# Altium schematic sheet f.main controller.SchDoc
size D; SheetNumber: 1; SheetTotal: 1
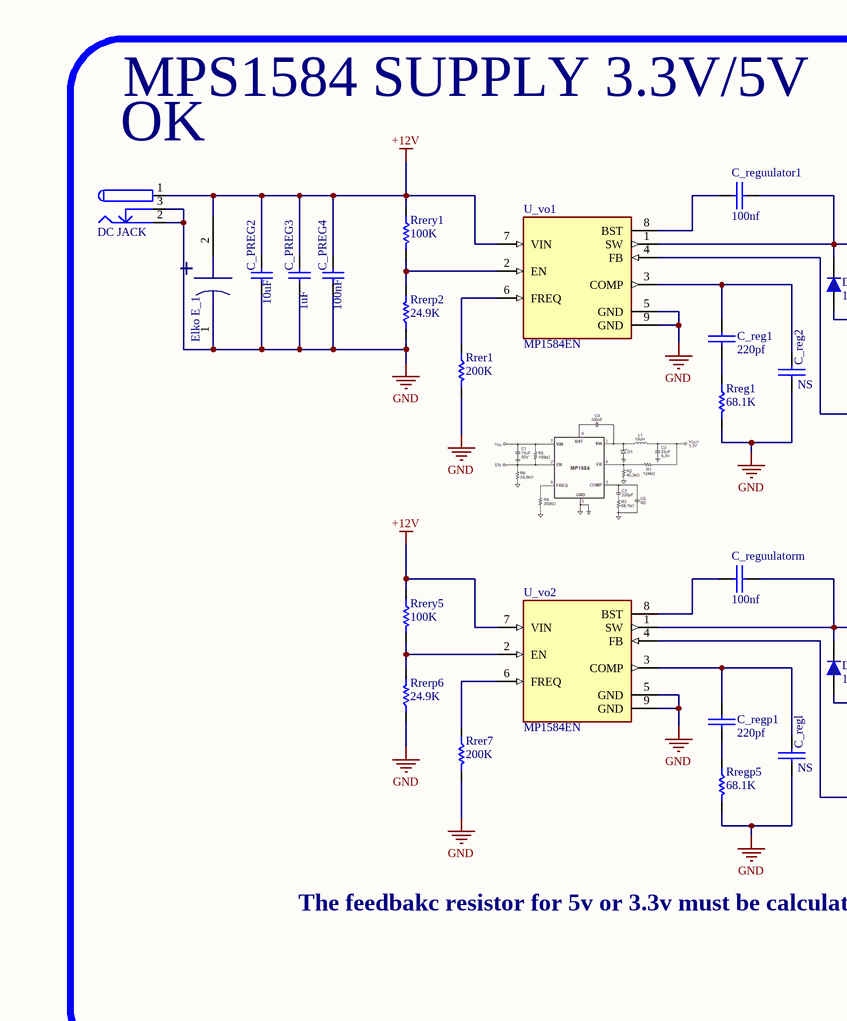
[diagram p0: f.main controller.SchDoc, top left]
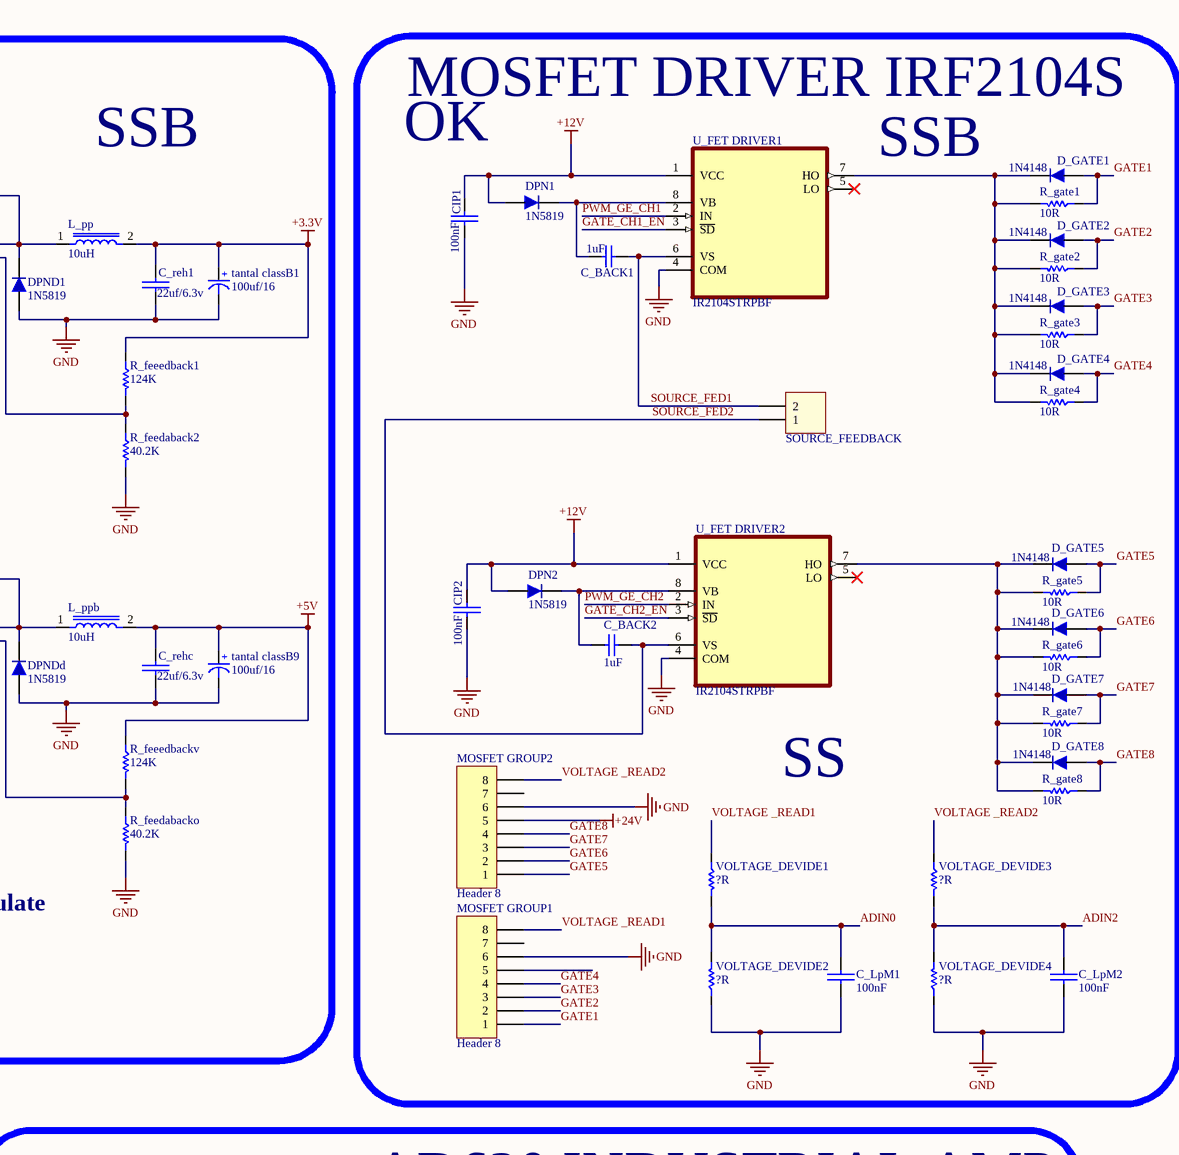
[diagram p1: f.main controller.SchDoc, top middle]
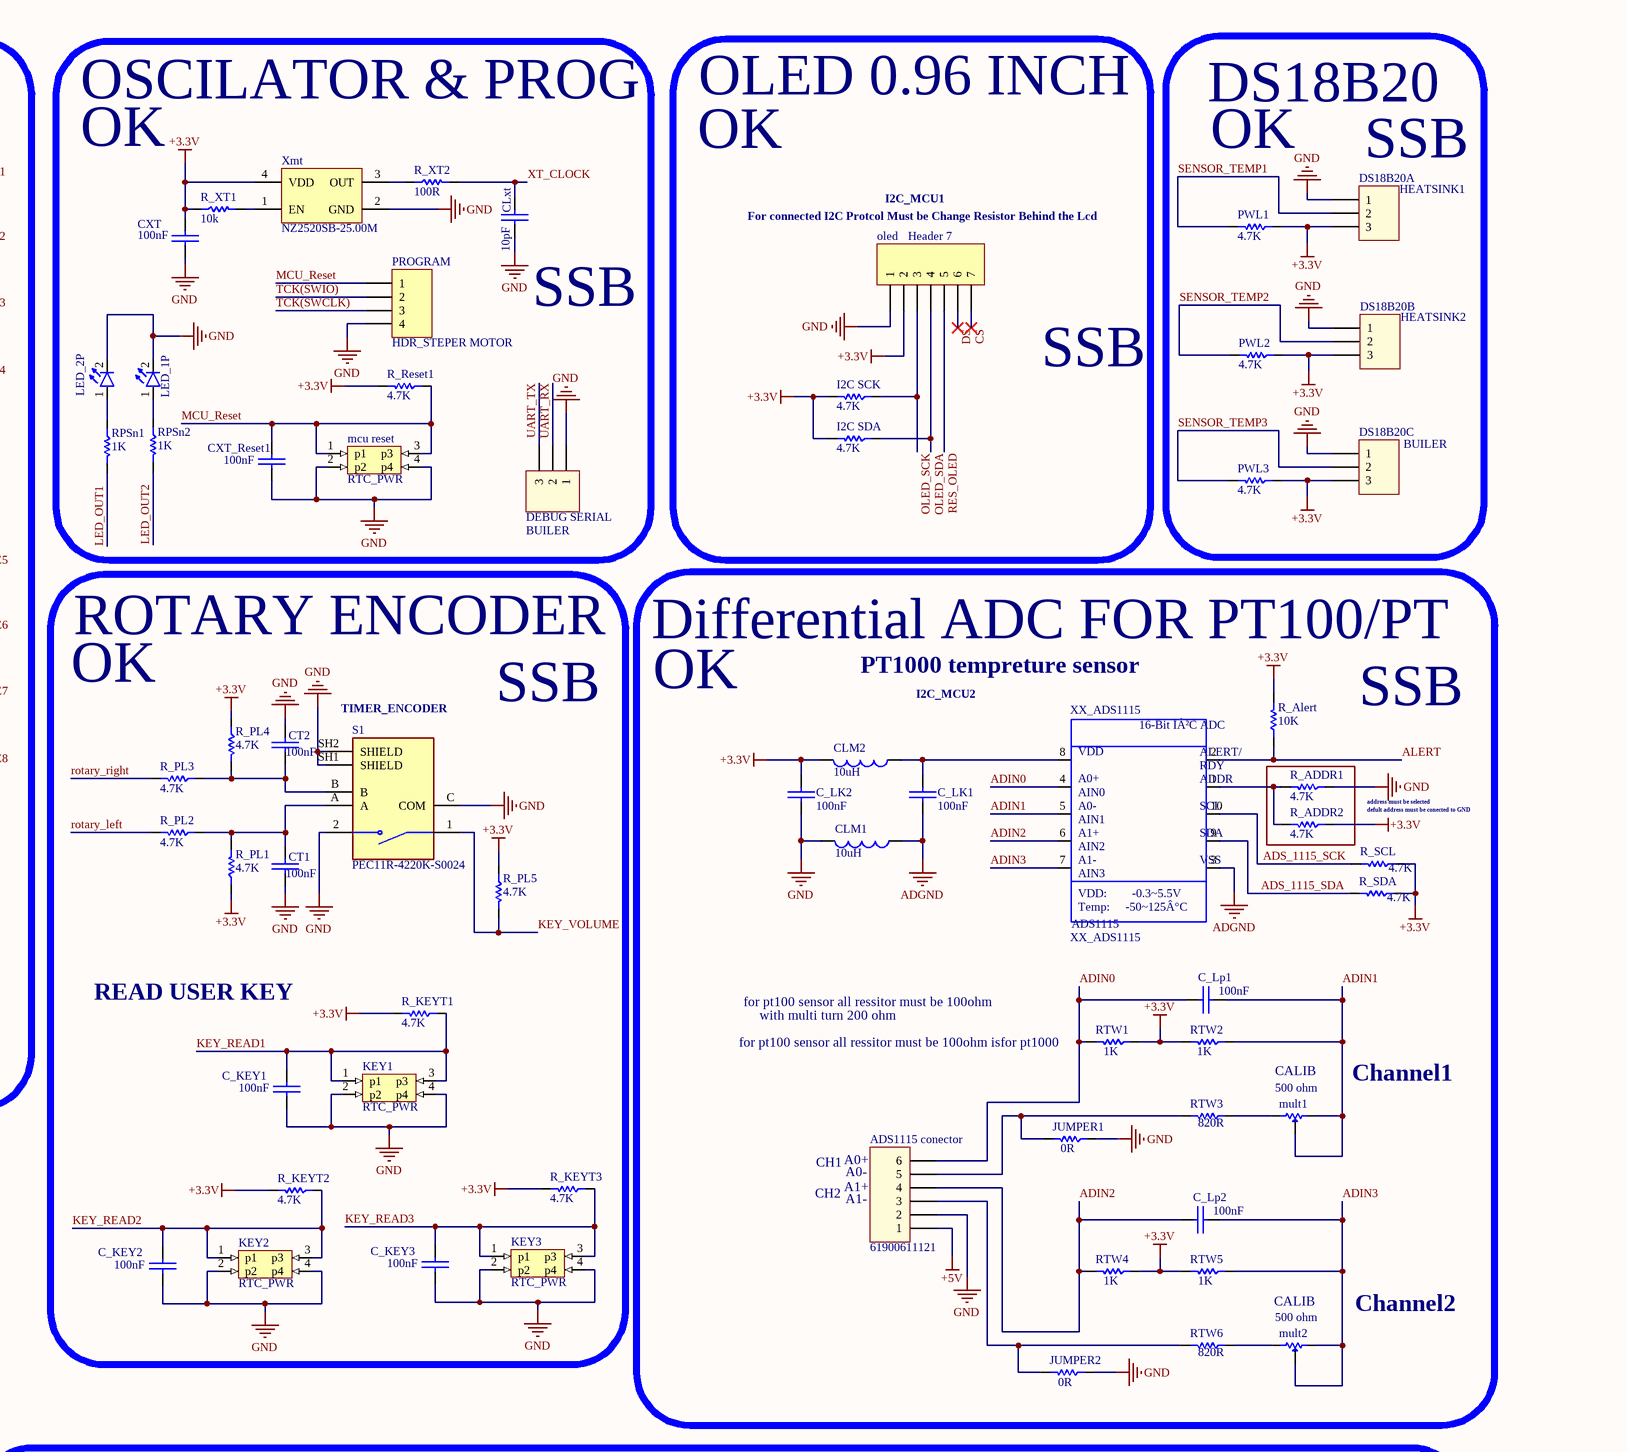
[diagram p2: f.main controller.SchDoc, top right]
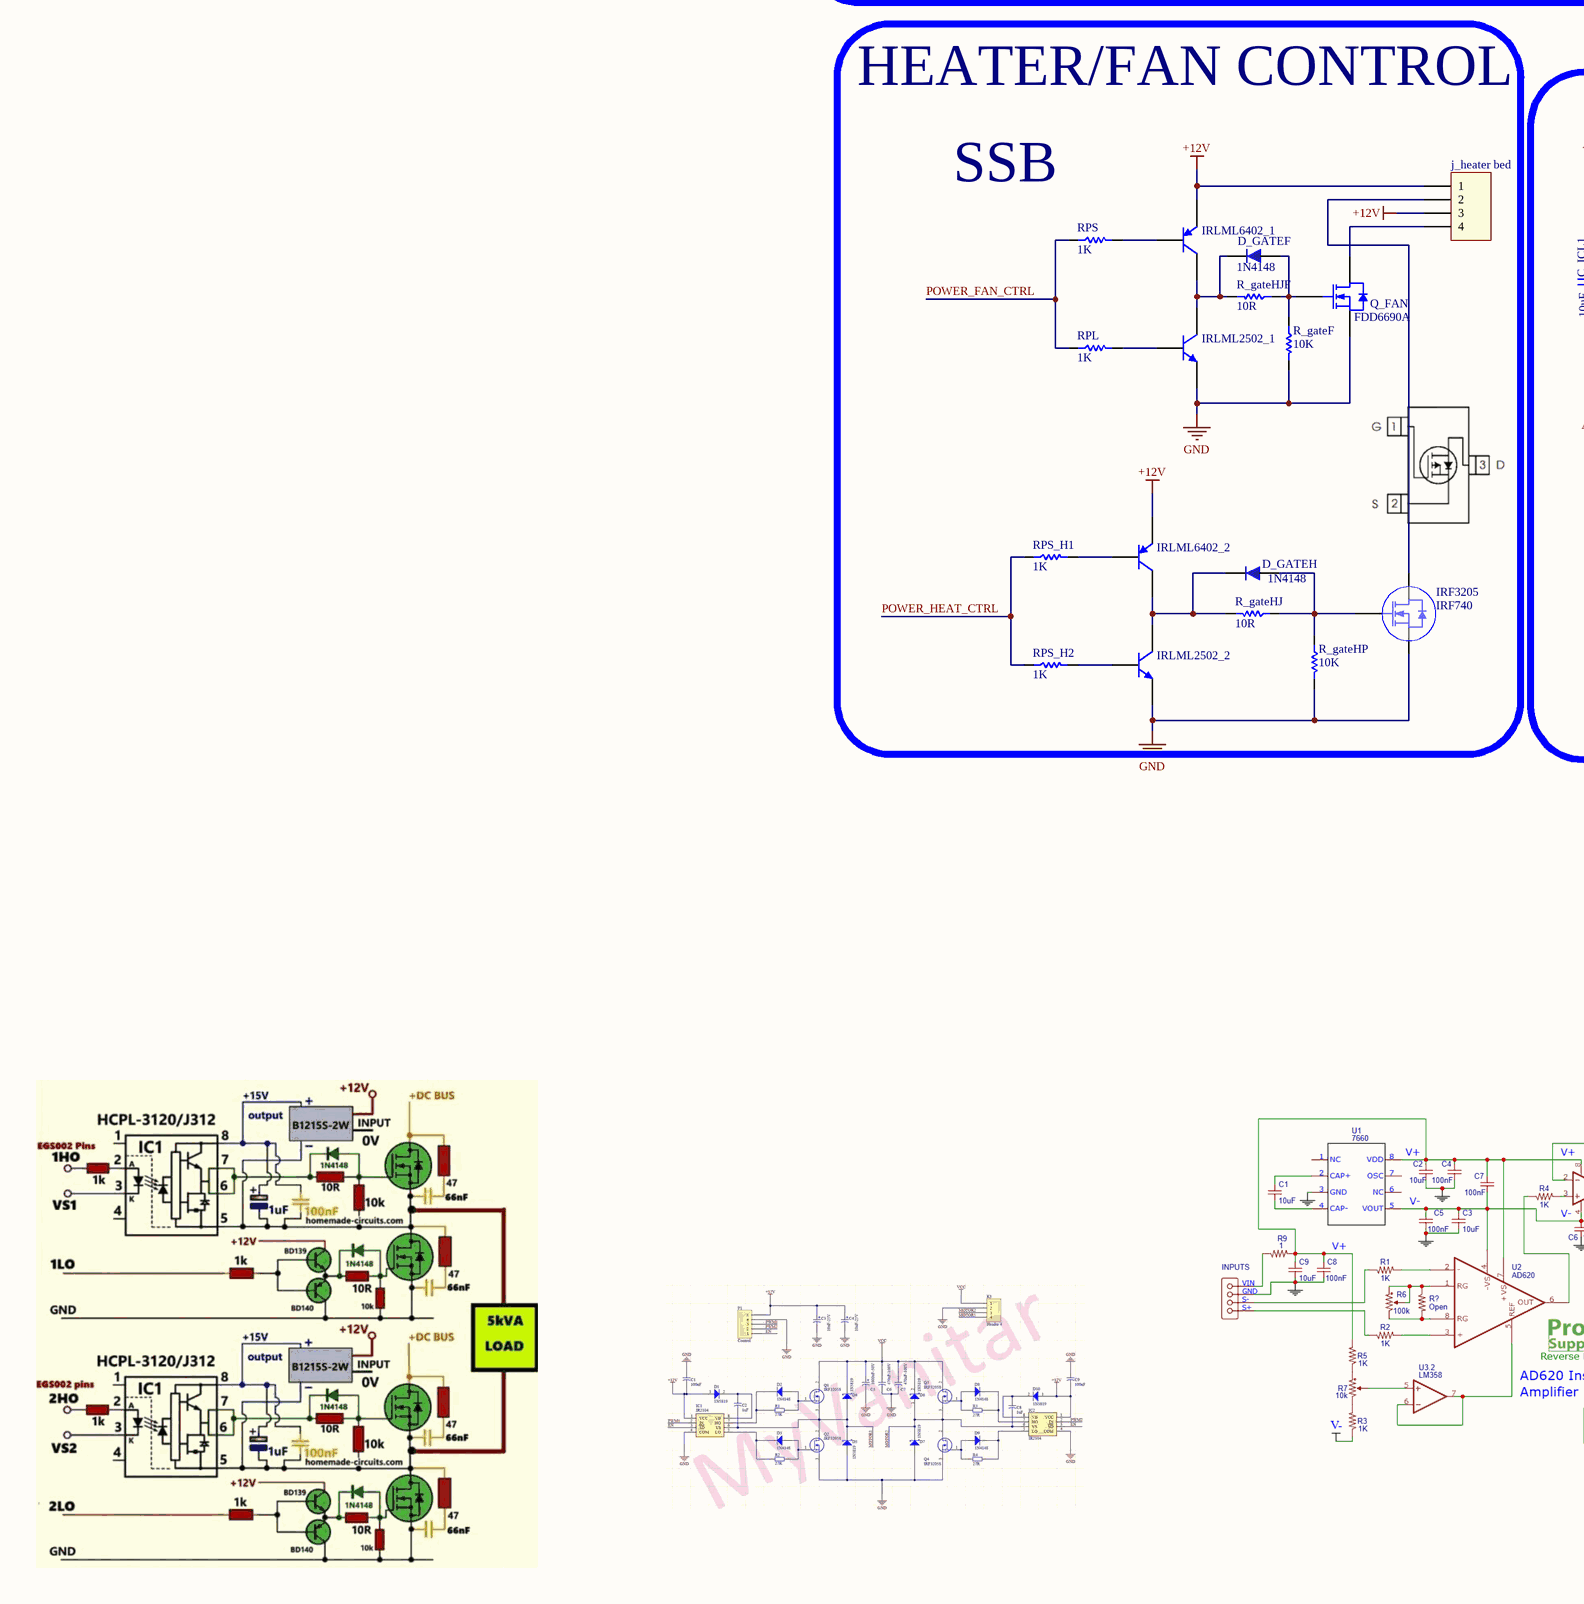
[diagram p3: f.main controller.SchDoc, bottom left]
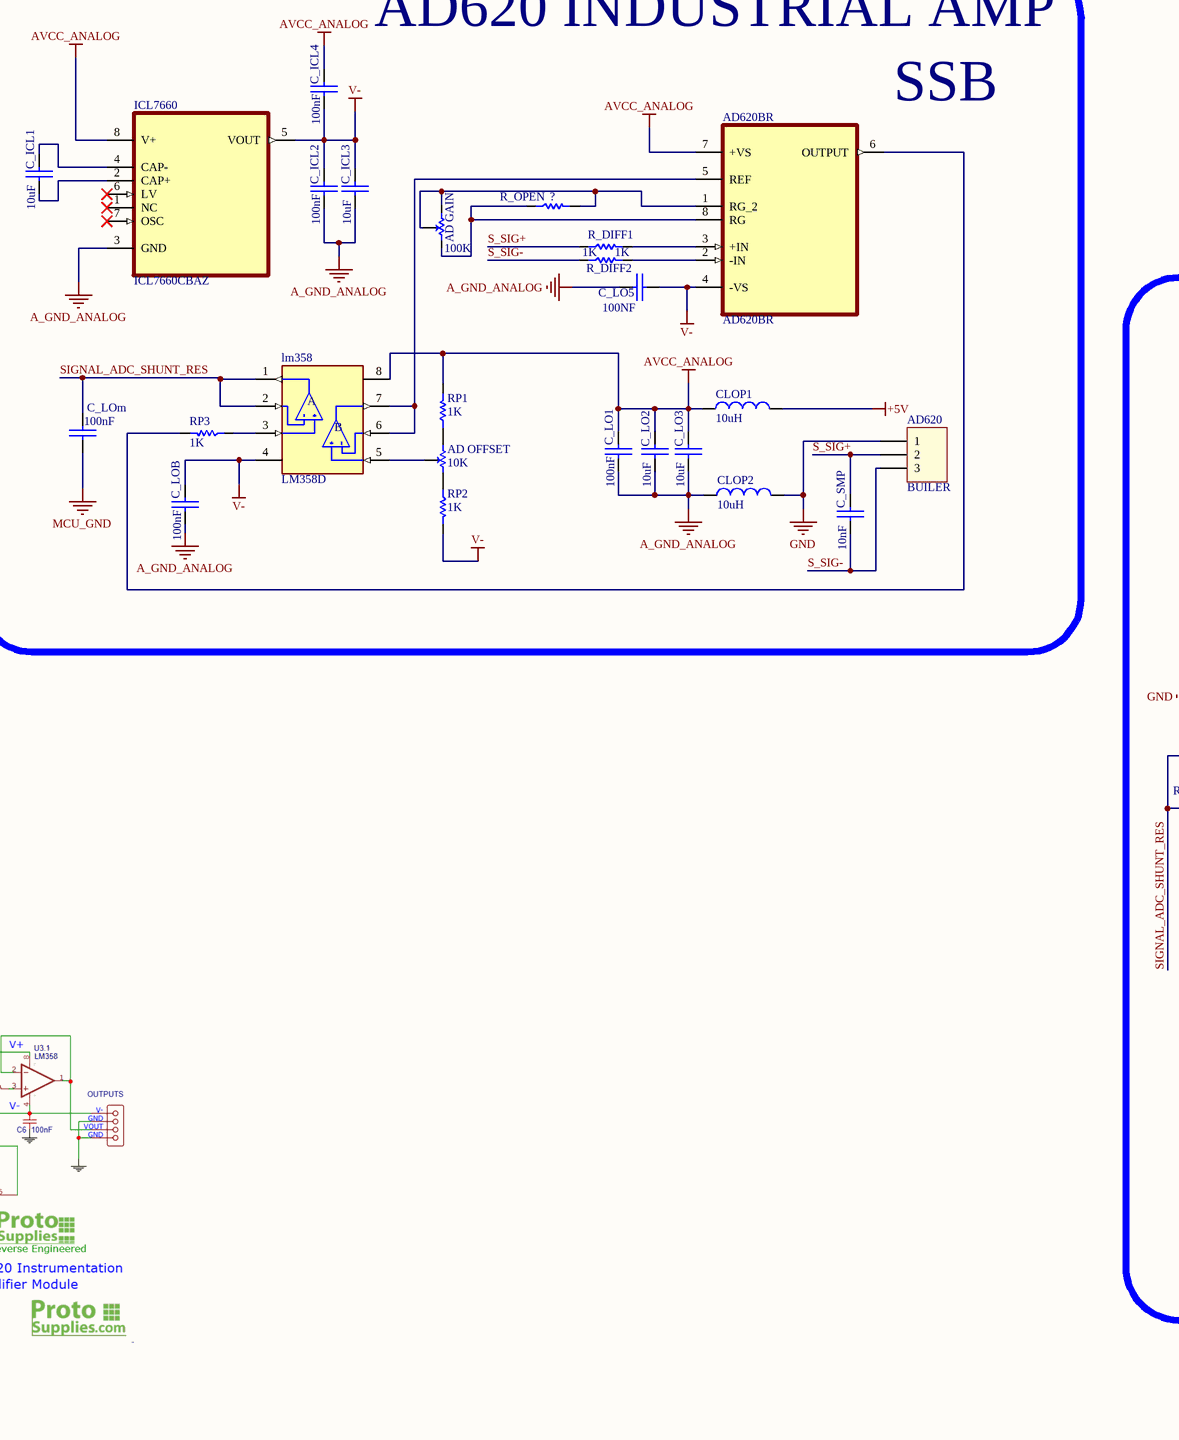
[diagram p4: f.main controller.SchDoc, bottom middle]
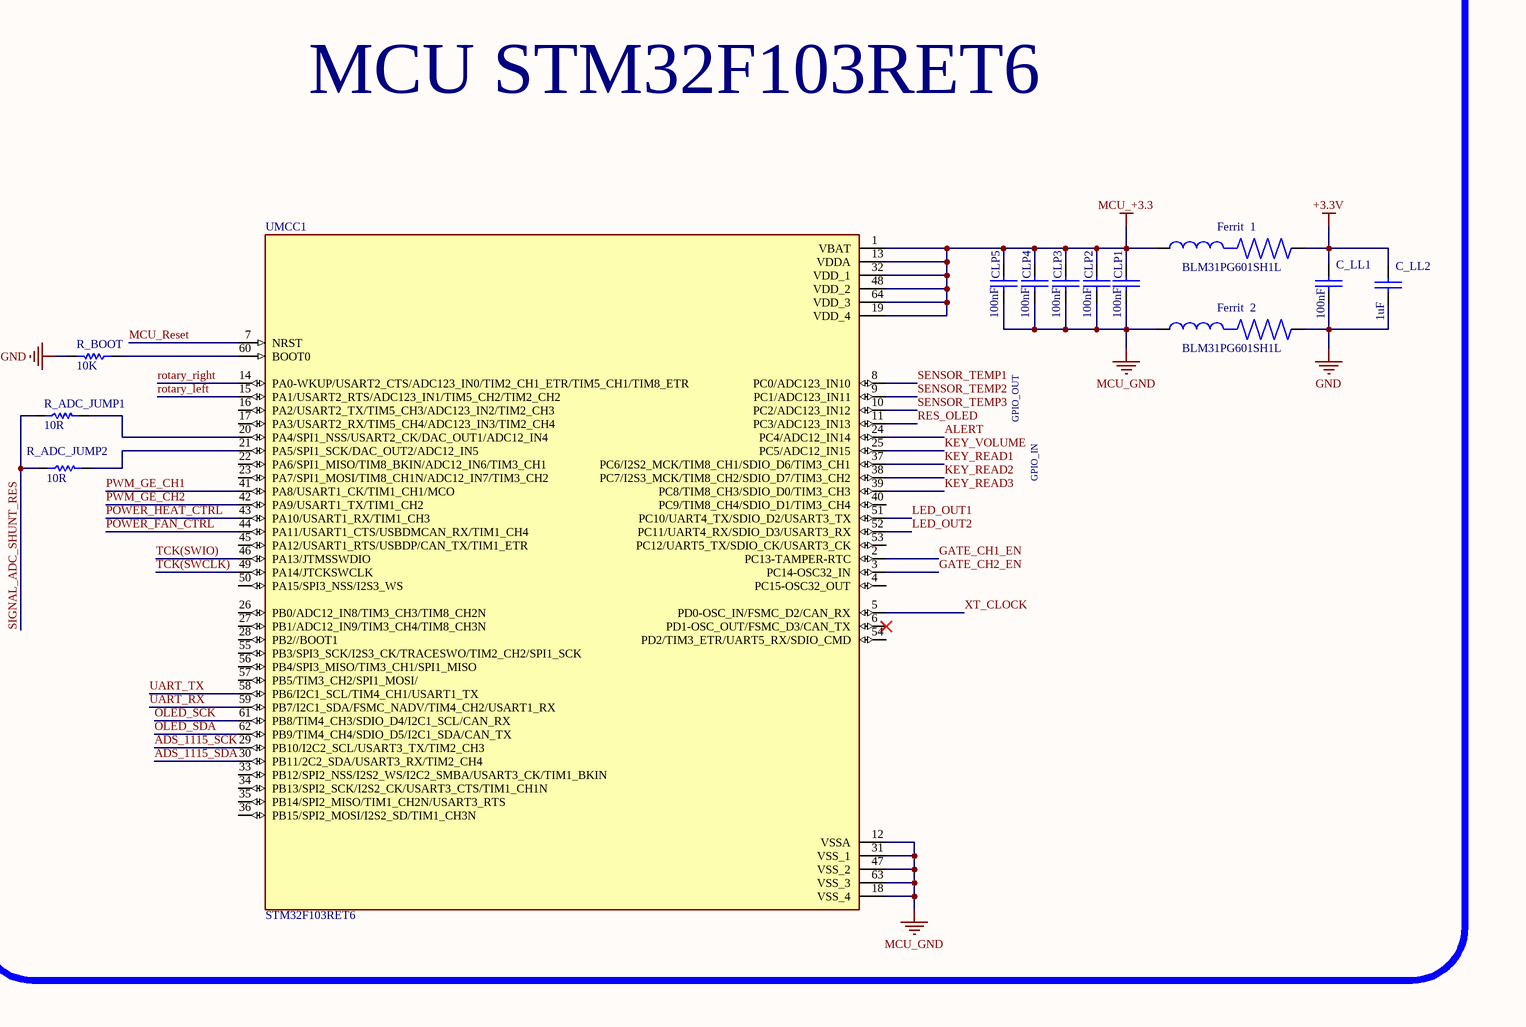
[diagram p5: f.main controller.SchDoc, bottom right]

## Parts
AD620  BUILER  [61900311121]
AD620BR  AD620BR  [SOIC127P600X175-8N]
AD_GAIN  100K  [Multi Turn]
AD_OFFSET  10K  [Multi Turn]
ADS1115_conector  61900611121  [61900611121]
C_BACK1  1uF  [CAPC4817X12N]
C_BACK2  1uF  [CAPC4817X12N]
C_ICL1  value 10uF  [SMD_CAP_0603]  (hidden comment: 100nf)
C_ICL2  100nf  [SMD_CAP_0603]
C_ICL3  value 10uF  [SMD_CAP_0603]  (hidden comment: 100nf)
C_ICL4  100nf  [SMD_CAP_0603]
C_KEY1  100nf  [SMD_CAP_0603]
C_KEY2  100nf  [SMD_CAP_0603]
C_KEY3  100nf  [SMD_CAP_0603]
C_LK1  100nf  [SMD_CAP_0603]
C_LK2  100nf  [SMD_CAP_0603]
C_LL1  100nf  [SMD_CAP_0603]
C_LL2  value 1uF  [SMD_CAP_0603]  (hidden comment: 100nf)
C_LO1  100nf  [SMD_CAP_0603]
C_LO2  value 10uF  [SMD_CAP_0603]  (hidden comment: 100nf)
C_LO3  value 10uF  [SMD_CAP_0603]  (hidden comment: 100nf)
C_LO5  100nf  [SMD_CAP_0603]
C_LOB  100nf  [SMD_CAP_0603]
C_LOm  100nf  [SMD_CAP_0603]
C_Lp1  100nf  [SMD_CAP_0603]
C_Lp2  100nf  [SMD_CAP_0603]
C_LpM1  100nf  [SMD_CAP_0603]
C_LpM2  100nf  [SMD_CAP_0603]
C_PREG2  10uF  [CAPC4817X12N]
C_PREG3  1uF  [CAPC4817X12N]
C_PREG4  100nF  [CAPC4817X12N]
C_reg1  value 220pf  [SMD_CAP_0603]  (hidden comment: 100nf)
C_reg2  NS  [SMD_CAP_0603]
C_regl  NS  [SMD_CAP_0603]
C_regp1  value 220pf  [SMD_CAP_0603]  (hidden comment: 100nf)
C_reguulator1  value 100nf  [SMD_CAP_0603]  (hidden comment: 22uf/6.3v)
C_reguulatorm  value 100nf  [SMD_CAP_0603]  (hidden comment: 22uf/6.3v)
C_reh1  22uf/6.3v  [SMD_CAP_0603]
C_rehc  22uf/6.3v  [SMD_CAP_0603]
C_SMP  10nf  [SMD_CAP_0603]
CIP1  100nf  [SMD_CAP_0603]
CIP2  100nf  [SMD_CAP_0603]
CLM1  10uH  [IND0805]
CLM2  10uH  [IND0805]
CLOP1  10uH  [IND0805]
CLOP2  10uH  [IND0805]
CLP1  100nf  [SMD_CAP_0603]
CLP2  100nf  [SMD_CAP_0603]
CLP3  100nf  [SMD_CAP_0603]
CLP4  100nf  [SMD_CAP_0603]
CLP5  100nf  [SMD_CAP_0603]
CLxt  value 10pF  [SMD_CAP_0603]  (hidden comment: 100nf)
CT1  100nf  [SMD_CAP_0603]
CT2  100nf  [SMD_CAP_0603]
CXT  100nf  [SMD_CAP_0603]
CXT_Reset1  100nf  [SMD_CAP_0603]
D_GATE1  1N4148  [Diode 1n4148 SMD]
D_GATE2  1N4148  [Diode 1n4148 SMD]
D_GATE3  1N4148  [Diode 1n4148 SMD]
D_GATE4  1N4148  [Diode 1n4148 SMD]
D_GATE5  1N4148  [Diode 1n4148 SMD]
D_GATE6  1N4148  [Diode 1n4148 SMD]
D_GATE7  1N4148  [Diode 1n4148 SMD]
D_GATE8  1N4148  [Diode 1n4148 SMD]
D_GATEF  1N4148  [Diode 1n4148 SMD]
D_GATEH  1N4148  [Diode 1n4148 SMD]
DC_JACK  DC Power Jack  [DC Power Jack 1]  (value not drawn)
DEBUG_SERIAL  BUILER  [61900311121]
DPN1  1N5819  [430X270D]
DPN2  1N5819  [430X270D]
DPND1  1N5819  [430X270D]
DPNDd  1N5819  [430X270D]
DS18B20A  HEATSINK1  [61900311121]
DS18B20B  HEATSINK2  [61900311121]
DS18B20C  BUILER  [61900311121]
Elko_E_1  Elko E package  [Elko E]  (value not drawn)
Ferrit_1  BLM31PG601SH1L  [BEADC3216X130N]
Ferrit_2  BLM31PG601SH1L  [BEADC3216X130N]
I2C_SCK  4.7K  [RES 0603 (1608X06L)]
I2C_SDA  4.7K  [RES 0603 (1608X06L)]
ICL7660  ICL7660CBAZ  [SOIC127P600X175-8N]
IRF3205  IRF740  [TO-220 AB]
IRLML2502_1  BC337  [SOT23_M]  (value not drawn)
IRLML2502_2  BC337  [SOT23_M]  (value not drawn)
IRLML6402_1  BC856  [SOT23_M]  (value not drawn)
IRLML6402_2  BC856  [SOT23_M]  (value not drawn)
j_heater_bed  (no value)  [645004114822]
JUMPER1  0R  [RES 0603 (1608X06L)]
JUMPER2  0R  [RES 0603 (1608X06L)]
KEY1  RTC_PWR  [push_bt]
KEY2  RTC_PWR  [push_bt]
KEY3  RTC_PWR  [push_bt]
L_pp  10uH  [IND_SRP6540-4R7M]
L_ppb  10uH  [IND_SRP6540-4R7M]
LED_1P  (no value)  [LED SMD 1206]
LED_2P  (no value)  [LED SMD 1206]
lm358  LM358D  [SOIC127P599X175-8N]
mcu_reset  RTC_PWR  [push_bt]
MOSFET_GROUP1  Header 8  [HDR1X8]
MOSFET_GROUP2  Header 8  [HDR1X8]
mult1  500 ohm  [Multi Turn]
mult2  500 ohm  [Multi Turn]
oled  Header 7  [HDR1X7]
PROGRAM  HDR_STEPER MOTOR  [CON WF_4]
PWL1  4.7K  [RES 0603 (1608X06L)]
PWL2  4.7K  [RES 0603 (1608X06L)]
PWL3  4.7K  [RES 0603 (1608X06L)]
Q_FAN  FDD6690A  [TO252-3L]
R_ADC_JUMP1  10R  [RES 0603 (1608X06L)]
R_ADC_JUMP2  10R  [RES 0603 (1608X06L)]
R_ADDR1  4.7K  [RES 0603 (1608X06L)]
R_ADDR2  4.7K  [RES 0603 (1608X06L)]
R_Alert  10K  [RES 0603 (1608X06L)]
R_BOOT  10K  [RES 0603 (1608X06L)]
R_DIFF1  1K  [RES 0603 (1608X06L)]
R_DIFF2  1K  [RES 0603 (1608X06L)]
R_feedaback2  40.2K  [RES 0603 (1608X06L)]
R_feedabacko  40.2K  [RES 0603 (1608X06L)]
R_feeedback1  124K  [RES 0603 (1608X06L)]
R_feeedbackv  124K  [RES 0603 (1608X06L)]
R_gate1  10R  [RES 0603 (1608X06L)]
R_gate2  10R  [RES 0603 (1608X06L)]
R_gate3  10R  [RES 0603 (1608X06L)]
R_gate4  10R  [RES 0603 (1608X06L)]
R_gate5  10R  [RES 0603 (1608X06L)]
R_gate6  10R  [RES 0603 (1608X06L)]
R_gate7  10R  [RES 0603 (1608X06L)]
R_gate8  10R  [RES 0603 (1608X06L)]
R_gateF  10K  [RES 0603 (1608X06L)]
R_gateHJ  10R  [RES 0603 (1608X06L)]
R_gateHJF  10R  [RES 0603 (1608X06L)]
R_gateHP  10K  [RES 0603 (1608X06L)]
R_KEYT1  4.7K  [RES 0603 (1608X06L)]
R_KEYT2  4.7K  [RES 0603 (1608X06L)]
R_KEYT3  4.7K  [RES 0603 (1608X06L)]
R_OPEN  ?  [RES 0603 (1608X06L)]
R_PL1  4.7K  [RES 0603 (1608X06L)]
R_PL2  4.7K  [RES 0603 (1608X06L)]
R_PL3  4.7K  [RES 0603 (1608X06L)]
R_PL4  4.7K  [RES 0603 (1608X06L)]
R_PL5  4.7K  [RES 0603 (1608X06L)]
R_Reset1  4.7K  [RES 0603 (1608X06L)]
R_SCL  4.7K  [RES 0603 (1608X06L)]
R_SDA  4.7K  [RES 0603 (1608X06L)]
R_XT1  10k  [RES 0603 (1608X06L)]
R_XT2  100R  [RES 0603 (1608X06L)]
RP1  1K  [RES 0603 (1608X06L)]
RP2  1K  [RES 0603 (1608X06L)]
RP3  1K  [RES 0603 (1608X06L)]
RPL  1K  [RES 0603 (1608X06L)]
RPS  1K  [RES 0603 (1608X06L)]
RPS_H1  1K  [RES 0603 (1608X06L)]
RPS_H2  1K  [RES 0603 (1608X06L)]
RPSn1  1K  [RES 0603 (1608X06L)]
RPSn2  1K  [RES 0603 (1608X06L)]
Rreg1  68.1K  [RES 0603 (1608X06L)]
Rregp5  68.1K  [RES 0603 (1608X06L)]
Rrer1  200K  [RES 0603 (1608X06L)]
Rrer7  200K  [RES 0603 (1608X06L)]
Rrerp2  24.9K  [RES 0603 (1608X06L)]
Rrerp6  24.9K  [RES 0603 (1608X06L)]
Rrery1  100K  [RES 0603 (1608X06L)]
Rrery5  100K  [RES 0603 (1608X06L)]
RTW1  1K  [RES 0603 (1608X06L)]
RTW2  1K  [RES 0603 (1608X06L)]
RTW3  820R  [RES 0603 (1608X06L)]
RTW4  1K  [RES 0603 (1608X06L)]
RTW5  1K  [RES 0603 (1608X06L)]
RTW6  820R  [RES 0603 (1608X06L)]
S1  PEC11R-4220K-S0024  [XDCR_PEC11R-4220K-S0024]
SOURCE_FEEDBACK  61900211121  [61900211121]  (value not drawn)
tantal_classB1  100uf/16  [TANTAL-CAP-Size B]
tantal_classB9  100uf/16  [TANTAL-CAP-Size B]
U_FET_DRIVER1  IR2104STRPBF  [SOIC127P600X175-8N]
U_FET_DRIVER2  IR2104STRPBF  [SOIC127P600X175-8N]
U_vo1  MP1584EN  [SOIC127P600X170-9N]
U_vo2  MP1584EN  [SOIC127P600X170-9N]
UMCC1  STM32F103RET6  [QFP50P1200X1200X160-64N]
VOLTAGE_DEVIDE1  ?R  [RES 0603 (1608X06L)]
VOLTAGE_DEVIDE2  ?R  [RES 0603 (1608X06L)]
VOLTAGE_DEVIDE3  ?R  [RES 0603 (1608X06L)]
VOLTAGE_DEVIDE4  ?R  [RES 0603 (1608X06L)]
Xmt  NZ2520SB-25.00M  [VCO]
XX_ADS1115  XX_ADS1115  [MSOP10]

## Blocks framed on the sheet
MCU STM32F103RET6: C_LL1 C_LL2 CLP1-CLP5 Ferrit_1 Ferrit_2 R_ADC_JUMP1 R_ADC_JUMP2 R_BOOT UMCC1

## Nets
+3.3V: C_LK2.2(-) C_LL1.1(+) C_LL2.1(+) C_reh1.1(+) CLM2.2 CXT.1(+) DS18B20A.3 DS18B20B.3 DS18B20C.3 Ferrit_1.2 I2C_SCK.2 I2C_SDA.2 L_pp.2 oled.2 PWL1.1 PWL2.1 PWL3.1 R_ADDR2.1 R_Alert.2 R_feeedback1.1 R_KEYT1.2 R_KEYT2.2 R_KEYT3.2 R_PL1.1 R_PL4.1 R_PL5.1 R_Reset1.2 R_SCL.1 R_SDA.1 R_XT1.1 RTW1.1 RTW2.2 RTW4.1 RTW5.2 tantal_classB1.2(+) Xmt.4(VDD)
+5V: ADS1115_conector.1 C_rehc.1(+) CLOP1.2 L_ppb.2 R_feeedbackv.1 tantal_classB9.2(+)
+12V: C_PREG2.2 C_PREG3.2 C_PREG4.2 CIP1.1(+) CIP2.1(+) DC_JACK.1 DPN1.1 DPN2.1 Elko_E_1.2 IRLML6402_1.2(E) IRLML6402_2.2(E) j_heater_bed.1 j_heater_bed.3 Rrery1.1 Rrery5.1 U_FET_DRIVER1.1(VCC) U_FET_DRIVER2.1(VCC) U_vo1.7(VIN) U_vo2.7(VIN)
+24V: MOSFET_GROUP2.5
A_GND_ANALOG: C_ICL2.2(-) C_ICL3.2(-) C_LO1.2(-) C_LO2.2(-) C_LO3.2(-) C_LO5.2(-) C_LOB.2(-) CLOP2.1 ICL7660.3(GND)
ADGND: C_LK1.1(+) CLM1.1 XX_ADS1115.3(VSS)
AVCC_ANALOG: AD620BR.7(+VS) C_ICL4.1(+) C_LO1.1(+) C_LO2.1(+) C_LO3.1(+) CLOP1.1 ICL7660.8(V+) lm358.8(V+) RP1.2
GND: AD620.1 ADS1115_conector.2 C_KEY1.2(-) C_KEY2.2(-) C_KEY3.2(-) C_LK2.1(+) C_LL1.2(-) C_LL2.2(-) C_LpM1.1(+) C_LpM2.1(+) C_PREG2.1 C_PREG3.1 C_PREG4.1 C_reg2.2(-) C_regl.2(-) C_reh1.2(-) C_rehc.2(-) CIP1.2(-) CIP2.2(-) CLM1.2 CLOP2.2 CLxt.2(-) CT1.2(-) CT2.1(+) CXT.2(-) CXT_Reset1.2(-) DC_JACK.2 DC_JACK.3 DEBUG_SERIAL.1 DPND1.1 DPNDd.1 DS18B20A.1 DS18B20B.1 DS18B20C.1 Elko_E_1.1 Ferrit_2.2 IRF3205.3(S) IRLML2502_1.2(E) IRLML2502_2.2(E) JUMPER1.1 JUMPER2.1 KEY1.2(p2) KEY1.4(p4) KEY2.2(p2) KEY2.4(p4) KEY3.2(p2) KEY3.4(p4) LED_1P.2(K) LED_2P.2(K) mcu_reset.2(p2) mcu_reset.4(p4) MOSFET_GROUP1.6 MOSFET_GROUP2.6 oled.1 PROGRAM.4 Q_FAN.3(S) R_ADDR1.1 R_BOOT.2 R_feedaback2.2 R_feedabacko.2 R_gateF.2 R_gateHP.2 Rreg1.2 Rregp5.2 Rrer1.2 Rrer7.2 Rrerp2.1 Rrerp6.1 S1.2 S1.C(COM) S1.SH1(SHIELD) S1.SH2(SHIELD) tantal_classB1.1(-) tantal_classB9.1(-) U_FET_DRIVER1.4(COM) U_FET_DRIVER2.4(COM) U_vo1.5(GND) U_vo1.9(GND) U_vo2.5(GND) U_vo2.9(GND) VOLTAGE_DEVIDE2.1 VOLTAGE_DEVIDE4.1 Xmt.2(GND)
MCU_+3.3: CLP1.1(+) CLP2.1(+) CLP3.1(+) CLP4.1(+) CLP5.1(+) Ferrit_1.1 UMCC1.1(VBAT) UMCC1.13(VDDA) UMCC1.19(VDD_4) UMCC1.32(VDD_1) UMCC1.48(VDD_2) UMCC1.64(VDD_3)
MCU_GND: C_LOm.2(-) CLP1.2(-) CLP2.2(-) CLP3.2(-) CLP4.2(-) CLP5.2(-) Ferrit_2.1 UMCC1.12(VSSA) UMCC1.18(VSS_4) UMCC1.31(VSS_1) UMCC1.47(VSS_2) UMCC1.63(VSS_3)
V-: AD620BR.4(-VS) C_ICL2.1(+) C_ICL3.1(+) C_ICL4.2(-) C_LO5.1(+) C_LOB.1(+) ICL7660.5(VOUT) lm358.4(V-) RP2.2
ADIN0: ADS1115_conector.6 C_Lp1.1(+) C_LpM1.2(-) RTW1.2 VOLTAGE_DEVIDE1.2 VOLTAGE_DEVIDE2.2 XX_ADS1115.4(AIN0)
ADIN1: C_Lp1.2(-) mult1.2(Setpoint) mult1.3(CW) RTW2.1 XX_ADS1115.5(AIN1)
ADIN2: ADS1115_conector.4 C_Lp2.1(+) C_LpM2.2(-) RTW4.2 VOLTAGE_DEVIDE3.2 VOLTAGE_DEVIDE4.2 XX_ADS1115.6(AIN2)
ADIN3: C_Lp2.2(-) mult2.2(Setpoint) mult2.3(CW) RTW5.1 XX_ADS1115.7(AIN3)
ADS_1115_SCK: R_SCL.2 UMCC1.29(PB10/I2C2_SCL/USART3_TX/TIM2_CH3) XX_ADS1115.10(SCL)
ADS_1115_SDA: R_SDA.2 UMCC1.30(PB11/2C2_SDA/USART3_RX/TIM2_CH4) XX_ADS1115.9(SDA)
ALERT: R_Alert.1 UMCC1.24(PC4/ADC12_IN14) XX_ADS1115.2(ALERT/RDY)
CS: oled.7
DS: oled.6
GATE1: D_GATE1.1 MOSFET_GROUP1.1 R_gate1.1
GATE2: D_GATE2.1 MOSFET_GROUP1.2 R_gate2.1
GATE3: D_GATE3.1 MOSFET_GROUP1.3 R_gate3.1
GATE4: D_GATE4.1 MOSFET_GROUP1.4 R_gate4.1
GATE5: D_GATE5.1 MOSFET_GROUP2.1 R_gate5.1
GATE6: D_GATE6.1 MOSFET_GROUP2.2 R_gate6.1
GATE7: D_GATE7.1 MOSFET_GROUP2.3 R_gate7.1
GATE8: D_GATE8.1 MOSFET_GROUP2.4 R_gate8.1
GATE_CH1_EN: U_FET_DRIVER1.3(~{SD}) UMCC1.2(PC13-TAMPER-RTC)
GATE_CH2_EN: U_FET_DRIVER2.3(~{SD}) UMCC1.3(PC14-OSC32_IN)
KEY_READ1: C_KEY1.1(+) KEY1.1(p1) KEY1.3(p3) R_KEYT1.1 UMCC1.37(PC6/I2S2_MCK/TIM8_CH1/SDIO_D6/TIM3_CH1)
KEY_READ2: C_KEY2.1(+) KEY2.1(p1) KEY2.3(p3) R_KEYT2.1 UMCC1.38(PC7/I2S3_MCK/TIM8_CH2/SDIO_D7/TIM3_CH2)
KEY_READ3: C_KEY3.1(+) KEY3.1(p1) KEY3.3(p3) R_KEYT3.1 UMCC1.39(PC8/TIM8_CH3/SDIO_D0/TIM3_CH3)
KEY_VOLUME: R_PL5.2 S1.1 UMCC1.25(PC5/ADC12_IN15)
LED_OUT1: RPSn1.2 UMCC1.51(PC10/UART4_TX/SDIO_D2/USART3_TX)
LED_OUT2: RPSn2.2 UMCC1.52(PC11/UART4_RX/SDIO_D3/USART3_RX)
MCU_Reset: CXT_Reset1.1(+) mcu_reset.1(p1) mcu_reset.3(p3) PROGRAM.1 R_Reset1.1 UMCC1.7(NRST)
OLED_SCK: I2C_SCK.1 oled.3 UMCC1.61(PB8/TIM4_CH3/SDIO_D4/I2C1_SCL/CAN_RX)
OLED_SDA: I2C_SDA.1 oled.4 UMCC1.62(PB9/TIM4_CH4/SDIO_D5/I2C1_SDA/CAN_TX)
POWER_FAN_CTRL: RPL.1 RPS.1 UMCC1.44(PA11/USART1_CTS/USBDMCAN_RX/TIM1_CH4)
POWER_HEAT_CTRL: RPS_H1.1 RPS_H2.1 UMCC1.43(PA10/USART1_RX/TIM1_CH3)
PWM_GE_CH1: U_FET_DRIVER1.2(IN) UMCC1.41(PA8/USART1_CK/TIM1_CH1/MCO)
PWM_GE_CH2: U_FET_DRIVER2.2(IN) UMCC1.42(PA9/USART1_TX/TIM1_CH2)
RES_OLED: oled.5 UMCC1.11(PC3/ADC123_IN13)
rotary_left: R_PL2.2 UMCC1.15(PA1/USART2_RTS/ADC123_IN1/TIM5_CH2/TIM2_CH2)
rotary_right: R_PL3.2 UMCC1.14(PA0-WKUP/USART2_CTS/ADC123_IN0/TIM2_CH1_ETR/TIM5_CH1/TIM8_ETR)
S_SIG+: AD620.2 C_SMP.1(+) R_DIFF1.1
S_SIG-: AD620.3 C_SMP.2(-) R_DIFF2.1
SENSOR_TEMP1: DS18B20A.2 PWL1.2 UMCC1.8(PC0/ADC123_IN10)
SENSOR_TEMP2: DS18B20B.2 PWL2.2 UMCC1.9(PC1/ADC123_IN11)
SENSOR_TEMP3: DS18B20C.2 PWL3.2 UMCC1.10(PC2/ADC123_IN12)
SIGNAL_ADC_SHUNT_RES: C_LOm.1(+) lm358.1(OUT1) lm358.2(IN1-) R_ADC_JUMP1.1 R_ADC_JUMP2.1
SOURCE_FED1: C_BACK1.2 SOURCE_FEEDBACK.2 U_FET_DRIVER1.6(VS)
SOURCE_FED2: C_BACK2.2 SOURCE_FEEDBACK.1 U_FET_DRIVER2.6(VS)
TCK(SWCLK): PROGRAM.3 UMCC1.49(PA14/JTCKSWCLK)
TCK(SWIO): PROGRAM.2 UMCC1.46(PA13/JTMSSWDIO)
UART_RX: DEBUG_SERIAL.2 UMCC1.59(PB7/I2C1_SDA/FSMC_NADV/TIM4_CH2/USART1_RX)
UART_TX: DEBUG_SERIAL.3 UMCC1.58(PB6/I2C1_SCL/TIM4_CH1/USART1_TX)
VOLTAGE _READ1: MOSFET_GROUP1.8 VOLTAGE_DEVIDE1.1
VOLTAGE _READ2: MOSFET_GROUP2.8 VOLTAGE_DEVIDE3.1
XT_CLOCK: CLxt.1(+) R_XT2.2 UMCC1.5(PD0-OSC_IN/FSMC_D2/CAN_RX)
NetAD620BR_1: AD620BR.1(RG_2) AD_GAIN.1(CCW) AD_GAIN.2(Setpoint) R_OPEN.2
NetAD620BR_2: AD620BR.2(-IN) R_DIFF2.2
NetAD620BR_3: AD620BR.3(+IN) R_DIFF1.2
NetAD620BR_5: AD620BR.5(REF) lm358.6(IN2-) lm358.7(OUT2)
NetAD620BR_6: AD620BR.6(OUTPUT) RP3.2
NetAD620BR_8: AD620BR.8(RG) AD_GAIN.3(CW) R_OPEN.1
NetAD_OFFSET_1: AD_OFFSET.1(CCW) RP1.1
NetAD_OFFSET_2: AD_OFFSET.2(Setpoint) lm358.5(IN2+)
NetAD_OFFSET_3: AD_OFFSET.3(CW) RP2.1
NetADS1115_conector_3: ADS1115_conector.3 JUMPER2.2 RTW6.2
NetADS1115_conector_5: ADS1115_conector.5 JUMPER1.2 RTW3.2
NetC_BACK1_1: C_BACK1.1 DPN1.2 U_FET_DRIVER1.8(VB)
NetC_BACK2_1: C_BACK2.1 DPN2.2 U_FET_DRIVER2.8(VB)
NetC_ICL1_1: C_ICL1.1(+) ICL7660.4(CAP-)
NetC_ICL1_2: C_ICL1.2(-) ICL7660.2(CAP+)
NetC_LK1_2: C_LK1.2(-) CLM2.1 XX_ADS1115.8(VDD)
NetC_reg1_1: C_reg1.1(+) C_reg2.1(+) U_vo1.3(COMP)
NetC_reg1_2: C_reg1.2(-) Rreg1.1
NetC_regl_1: C_regl.1(+) C_regp1.1(+) U_vo2.3(COMP)
NetC_regp1_2: C_regp1.2(-) Rregp5.1
NetC_reguulator1_1: C_reguulator1.1(+) DPND1.2 L_pp.1 U_vo1.1(SW)
NetC_reguulator1_2: C_reguulator1.2(-) U_vo1.8(BST)
NetC_reguulatorm_1: C_reguulatorm.1(+) DPNDd.2 L_ppb.1 U_vo2.1(SW)
NetC_reguulatorm_2: C_reguulatorm.2(-) U_vo2.8(BST)
NetCT1_1: CT1.1(+) R_PL1.2 R_PL2.1 S1.A
NetCT2_2: CT2.2(-) R_PL3.1 R_PL4.2 S1.B
NetD_GATE1_2: D_GATE1.2 D_GATE2.2 D_GATE3.2 D_GATE4.2 R_gate1.2 R_gate2.2 R_gate3.2 R_gate4.2 U_FET_DRIVER1.7(HO)
NetD_GATE5_2: D_GATE5.2 D_GATE6.2 D_GATE7.2 D_GATE8.2 R_gate5.2 R_gate6.2 R_gate7.2 R_gate8.2 U_FET_DRIVER2.7(HO)
NetD_GATEF_1: D_GATEF.1 Q_FAN.1(G) R_gateF.1 R_gateHJF.1
NetD_GATEF_2: D_GATEF.2 IRLML2502_1.3(C) IRLML6402_1.3(C) R_gateHJF.2
NetD_GATEH_1: D_GATEH.1 IRF3205.1(G) R_gateHJ.1 R_gateHP.1
NetD_GATEH_2: D_GATEH.2 IRLML2502_2.3(C) IRLML6402_2.3(C) R_gateHJ.2
NetIRF3205_2: IRF3205.2(D) j_heater_bed.2
NetIRLML2502_1_1: IRLML2502_1.1(B) RPL.2
NetIRLML2502_2_1: IRLML2502_2.1(B) RPS_H2.2
NetIRLML6402_1_1: IRLML6402_1.1(B) RPS.2
NetIRLML6402_2_1: IRLML6402_2.1(B) RPS_H1.2
Netj_heater_bed_4: j_heater_bed.4 Q_FAN.4(D)
NetLED_1P_1: LED_1P.1(A) RPSn2.1
NetLED_2P_1: LED_2P.1(A) RPSn1.1
Netlm358_3: lm358.3(IN1+) RP3.1
Netmult1_1: mult1.1(CCW) RTW3.1
Netmult2_1: mult2.1(CCW) RTW6.1
NetR_ADC_JUMP1_2: R_ADC_JUMP1.2 UMCC1.20(PA4/SPI1_NSS/USART2_CK/DAC_OUT1/ADC12_IN4)
NetR_ADC_JUMP2_2: R_ADC_JUMP2.2 UMCC1.21(PA5/SPI1_SCK/DAC_OUT2/ADC12_IN5)
NetR_ADDR1_2: R_ADDR1.2 R_ADDR2.2 XX_ADS1115.1(ADDR)
NetR_BOOT_1: R_BOOT.1 UMCC1.60(BOOT0)
NetR_feedaback2_1: R_feedaback2.1 R_feeedback1.2 U_vo1.4(FB)
NetR_feedabacko_1: R_feedabacko.1 R_feeedbackv.2 U_vo2.4(FB)
NetR_XT1_2: R_XT1.2 Xmt.1(EN)
NetR_XT2_1: R_XT2.1 Xmt.3(OUT)
NetRrer1_1: Rrer1.1 U_vo1.6(FREQ)
NetRrer7_1: Rrer7.1 U_vo2.6(FREQ)
NetRrerp2_2: Rrerp2.2 Rrery1.2 U_vo1.2(EN)
NetRrerp6_2: Rrerp6.2 Rrery5.2 U_vo2.2(EN)

Not connected (* = marked no-connect by the designer): ICL7660 1(NC)* 6(LV)* 7(OSC)*; MOSFET_GROUP1 5 7; MOSFET_GROUP2 7; U_FET_DRIVER1 5(LO)*; U_FET_DRIVER2 5(LO)*; UMCC1 4(PC15-OSC32_OUT) 6(PD1-OSC_OUT/FSMC_D3/CAN_TX)* 16(PA2/USART2_TX/TIM5_CH3/ADC123_IN2/TIM2_CH3) 17(PA3/USART2_RX/TIM5_CH4/ADC123_IN3/TIM2_CH4) 22(PA6/SPI1_MISO/TIM8_BKIN/ADC12_IN6/TIM3_CH1) 23(PA7/SPI1_MOSI/TIM8_CH1N/ADC12_IN7/TIM3_CH2) 26(PB0/ADC12_IN8/TIM3_CH3/TIM8_CH2N) 27(PB1/ADC12_IN9/TIM3_CH4/TIM8_CH3N) 28(PB2//BOOT1) 33(PB12/SPI2_NSS/I2S2_WS/I2C2_SMBA/USART3_CK/TIM1_BKIN) 34(PB13/SPI2_SCK/I2S2_CK/USART3_CTS/TIM1_CH1N) 35(PB14/SPI2_MISO/TIM1_CH2N/USART3_RTS) 36(PB15/SPI2_MOSI/I2S2_SD/TIM1_CH3N) 40(PC9/TIM8_CH4/SDIO_D1/TIM3_CH4) 45(PA12/USART1_RTS/USBDP/CAN_TX/TIM1_ETR) 50(PA15/SPI3_NSS/I2S3_WS) 53(PC12/UART5_TX/SDIO_CK/USART3_CK) 54(PD2/TIM3_ETR/UART5_RX/SDIO_CMD) 55(PB3/SPI3_SCK/I2S3_CK/TRACESWO/TIM2_CH2/SPI1_SCK) 56(PB4/SPI3_MISO/TIM3_CH1/SPI1_MISO) 57(PB5/TIM3_CH2/SPI1_MOSI/)

## Notes on the sheet
- MPS1584 SUPPLY 3.3V/5V
- MOSFET DRIVER IRF2104S
- OSCILATOR & PROG
- OLED 0.96 INCH
- DS18B20
- (near DC_JACK) OK
- SSB
- OK
- (near U_FET_DRIVER1) SSB
- I2C_MCU1
- (near DS18B20A) SSB
- For connected I2C Protcol Must be Change Resistor Behind the Lcd
- (near CLxt) SSB
- ROTARY ENCODER
- (near R_Alert) Differential ADC FOR PT100/PT
- PT1000 tempreture sensor
- (near S1) TIMER_ENCODER
- I2C_MCU2
- SS
- address must be selected
- defult address must be conected to GND
- (near R_feedabacko) The feedbakc resistor for 5v or 3.3v must be calculate
- READ USER KEY
- for pt100 sensor all ressitor must be 100ohm
- with multi turn 200 ohm
- (near RTW1) for pt100 sensor all ressitor must be 100ohm isfor pt1000
- CALIB
- Channel1
- HEATER/FAN CONTROL
- AD620 INDUSTRIAL AMP
- CH2
- CH1
- (near ADS1115_conector) A0+
- (near ADS1115_conector) A1+
- (near ADS1115_conector) A0-
- (near ADS1115_conector) A1-
- (near AD620BR) SSB
- (near mult2) CALIB
- Channel2
- GPIO_OUT
- GPIO_IN
- (in symbol ADS1115) 16-Bit IÂ²C ADC; ALERT/; RDY; A0+; A0-; A1+; A1-; VDD:; -0.3~5.5V; Temp:; -50~125Â°C
- (in symbol Elko E package) +
- (in symbol LM358D) A; B

## Library data of the parts
AD620 DEBUG_SERIAL DS18B20A DS18B20B DS18B20C = 61900311121: WR-WTB 2.54mm Male Locking Header, 3p; Pin Number: 3; ComponentLink1Description: Manufacturer; ComponentLink1URL: http://www.we-online.de; ComponentLink2Description: Datasheet; ComponentLink2URL: http://katalog.we-online.de/em/datasheet/6190xx11121.pdf; Part Number: 61900311121; Published Date: June 2017; Publisher: Wurth Elektronik; Pitch: 2.54 mm
AD620BR = AD620BR: Instrumentation Amplifier 1 Circuit - 8-SOIC; MF: Analog Devices; SnapEDA_Link: https://www.snapeda.com/parts/AD620BR/Analog+Devices/view-part/?ref=snap; Package: SOIC-8 Analog Devices; Value: *; MP: AD620BR; Check_prices: https://www.snapeda.com/parts/AD620BR/Analog+Devices/view-part/?ref=eda
AD_GAIN AD_OFFSET mult1 mult2 = Resistor Variable: Variable Resistor
ADS1115_conector = 61900611121: WR-WTB 2.54mm Male Locking Header, 6p; Pin Number: 6; ComponentLink1Description: Manufacturer; ComponentLink1URL: http://www.we-online.de; ComponentLink2Description: Datasheet; ComponentLink2URL: http://katalog.we-online.de/em/datasheet/6190xx11121.pdf; Part Number: 61900611121; Published Date: June 2017; Publisher: Wurth Elektronik; Pitch: 2.54 mm
C_BACK1 C_BACK2 C_PREG2-C_PREG4 = CAP SMD 1206: CAP 1206; Designer: Abbas Basereh; Desc.: CAP SMD 1206; Data: 16-12-2016
C_ICL1-C_ICL4 C_KEY1-C_KEY3 C_LK1 C_LK2 C_LL1 C_LL2 C_LO1-C_LO3 C_LO5 C_LOB C_LOm C_Lp1 C_Lp2 C_LpM1 C_LpM2 C_reg1 C_reg2 C_regl C_regp1 C_reguulator1 C_reguulatorm C_reh1 C_rehc C_SMP CIP1 CIP2 CLP1-CLP5 CLxt CT1 CT2 CXT CXT_Reset1 = Cap-Bipolar: Bipolar Capacitor; Voltage: 100V; Designer: Saeid Jorablo; Organazation: ControTec; Adding Date: 1387/12/20
  C_ICL2 C_ICL4 C_KEY1-C_KEY3 C_LK1 C_LK2 C_LL1 C_LO1 C_LOB C_LOm C_Lp1 C_Lp2 C_LpM1 C_LpM2 CIP1 CIP2 CLP1-CLP5 CT1 CT2 CXT CXT_Reset1: Value: 100nF
  C_LO5: Value: 100NF
  C_reh1 C_rehc: Value: 22uf/6.3v
  C_SMP: Value: 10nF
CLM1 CLM2 CLOP1 CLOP2 = INDUCTOR SMD PACKAGE: TOTAL INDUCTOR SMD PACK; Designer: Abbas Basereh; Desc.: INDUCTOR  SMD TOTAL PACKAGES; VALUE: 1u; Data: 2017-3-10
D_GATE1-D_GATE8 D_GATEF D_GATEH = 1N4148 SMD: General Semicoductor
DC_JACK = DC Power Jack: DC Power Jack. Center Pin 2.5mm. Diameter: 5.7mm; Designer: Ali Hafizi; Company: Personal; Project Name: Laser; Adding Date: 10/21/2009
DPN1 DPN2 DPND1 DPNDd = 1N5819: Schottkey Rectifiers; Designer: Abbas Basereh; Data: 16-12-2016; Link: *; Part. No: *
Ferrit_1 Ferrit_2 = BLM31PG601SH1L: FERRITE BEAD 600 OHM 1206 1LN; Package: None; Price: None; Value: *; MP: BLM31PG601SH1L; Availability: Unavailable
I2C_SCK I2C_SDA JUMPER1 JUMPER2 PWL1-PWL3 R_ADC_JUMP1 R_ADC_JUMP2 R_ADDR1 R_ADDR2 R_Alert R_BOOT R_DIFF1 R_DIFF2 R_feedaback2 R_feedabacko R_feeedback1 R_feeedbackv R_gate1-R_gate8 R_gateF R_gateHJ R_gateHJF R_gateHP R_KEYT1-R_KEYT3 R_OPEN R_PL1-R_PL5 R_Reset1 R_SCL R_SDA R_XT1 R_XT2 RP1-RP3 RPL RPS RPS_H1 RPS_H2 RPSn1 RPSn2 Rreg1 Rregp5 Rrer1 Rrer7 Rrerp2 Rrerp6 Rrery1 Rrery5 RTW1-RTW6 VOLTAGE_DEVIDE1-VOLTAGE_DEVIDE4 = Resistor
ICL7660 = ICL7660CBAZ: Charge Pump Switching Regulator IC Positive or Negative Fixed -Vin, 2Vin 1 Output 45mA 8-SOIC (0.154, 3.90mm Width); MF: Renesas Electronics America Inc; SnapEDA_Link: https://www.snapeda.com/parts/ICL7660CBAZ/Renesas/view-part/?ref=snap; Package: SOIC-8 Renesas Electronics America Inc; Value: *; MP: ICL7660CBAZ; Check_prices: https://www.snapeda.com/parts/ICL7660CBAZ/Renesas/view-part/?ref=eda
IRF3205 = IRF740: MOSFET N-CH 400V 10A TO-220AB; Published: 2017-1-12; DatasheetVersion: 2017-1-12; PackageVersion: 2017-1-12; PackageReference: TO-220AB; Publisher: Abbas Basereh; PackageDescription: MOSFET N-CH 400V 10A TO-220AB; ComponentLink1Description: http://www.digikey.com/products/en/discrete-semiconductor-products/19; ComponentLink1URL: http://www.digikey.com/product-detail/en/vishay-siliconix/IRF740PBF/IRF740PBF-ND/812037; ComponentLink2Description: Datasheet; ComponentLink2URL: http://www.roboeq.ir/files/id/1101/name/IRF740A.pdf
IRLML2502_1 IRLML2502_2 = BC337: 45 V, 500 mA NPN general-purpose transistors; Published: 2017-2-8; LatestRevisionDate: 2017; LatestRevisionNote: IPC-7351 Footprint Added.; DatasheetVersion: 2017; PackageVersion: 2017-2-8; PackageReference: SOT23; Publisher: Abbas Basereh; PackageDescription: 3-Pin SOT-23 Package 0.95 mm Pitch, 2.3 mm Lead Span; ComponentLink1Description: Manufacturer Link; ComponentLink1URL: http://www.nxp.com/; ComponentLink2Description: Datasheet; ComponentLink2URL: http://www.nxp.com/
IRLML6402_1 IRLML6402_2 = BC856: PNP General-purpose Transistor; Published: 2017-1-6; LatestRevisionDate: 12-Dec-2006; LatestRevisionNote: IPC-7351 Footprint Added.; DatasheetVersion: 4-Feb-2002; PackageVersion: 2017-1-6; PackageReference: SOT23; Publisher: Abbas Basereh; PackageDescription: 3-Pin SOT-23 Package 0.95 mm Pitch, 2.3 mm Lead Span; ComponentLink1Description: Manufacturer Link; ComponentLink1URL: http://www.semiconductors.philips.com/; ComponentLink2Description: Datasheet; ComponentLink2URL: http://www.semiconductors.philips.com/acrobat/datasheets/BC856_BC857_BC858_6.pdf
j_heater_bed = 645004114822: WR-WTB 3.96mm Male Locking Header, 4p; Pin Number: 4; ComponentLink1Description: Manufacturer; ComponentLink1URL: http://www.we-online.de; ComponentLink2Description: Datasheet; ComponentLink2URL: http://katalog.we-online.de/em/datasheet/6450xx114822.pdf; Part Number: 645004114822; Published Date: June 2017; Publisher: Wurth Elektronik; Pitch: 3.96 mm
KEY1-KEY3 mcu_reset = push_button
L_pp L_ppb = SRP6540-4R7M: 4.7 ÂµH Shielded Drum Core, Wirewound Inductor 6 A 33.5mOhm Max Nonstandard; MF: Bourns; Price: None; Package: Nonstandard Bourns; Purchase-URL: https://pricing.snapeda.com/search/part/SRP6540-4R7M/?ref=eda; Availability: In Stock; SnapEDA_Link: https://www.snapeda.com/parts/SRP6540-4R7M/Bourns/view-part/?ref=snap; Value: *; MP: SRP6540-4R7M; Check_prices: https://www.snapeda.com/parts/SRP6540-4R7M/Bourns/view-part/?ref=eda
LED_1P LED_2P = LED: Designer: Saeid Jorablo; Organazation: ControTec; Adding Date: 1387/12/22
lm358 = LM358D: Op Amp Dual Low Power Amplifier Â±15V/30V 8-Pin SO N Tube; MF: STMicroelectronics; SnapEDA_Link: https://www.snapeda.com/parts/LM358D/STMicroelectronics/view-part/?ref=snap; Package: None; Value: *; MP: LM358D; Check_prices: https://www.snapeda.com/parts/LM358D/STMicroelectronics/view-part/?ref=eda
MOSFET_GROUP1 MOSFET_GROUP2 = Header 8: Header, 8-Pin; LatestRevisionDate: 17-Jul-2002; LatestRevisionNote: Re-released for DXP Platform.; Publisher: Altium Limited
oled = Header 7: Header, 7-Pin; LatestRevisionDate: 17-Jul-2002; LatestRevisionNote: Re-released for DXP Platform.; Publisher: Altium Limited
PROGRAM = Header 4 PIN Telecom.: Header, 4-Pin Telecom.; Designer: Abbas Basereh; Data: 16-12-2016; Link: *; Part. No: *
Q_FAN = FDD6690A: N-channel MOSFET; Note: Pin 2 is trimmed (and not drawn) and is electrically connected to Drain; Published: 2017-1-6; DatasheetVersion: 2017-1-6; PackageVersion: 2017-1-6; PackageReference: D-PAK TO-252; Publisher: Abbas Basereh; PackageDescription: D-PAK TO-252; ComponentLink1Description: Manufacturer Link; ComponentLink2Description: Datasheet; ComponentLink2URL: http://www.roboeq.ir/files/id/2900/name/FDD6690.pdf/
S1 = PEC11R-4220K-S0024: 24 Pulse Incremental Mechanical Rotary Encoder w/ 6 mm Knurl Shaft,Through Hole | Bourns PEC11R-4220K-S0024; SnapEDA_Link: https://www.snapeda.com/parts/PEC11R-4220K-S0024/Bourns/view-part/?ref=snap; Package: None; Value: *; MF: Bourns; MP: PEC11R-4220K-S0024; Check_prices: https://www.snapeda.com/parts/PEC11R-4220K-S0024/Bourns/view-part/?ref=eda
SOURCE_FEEDBACK = 61900211121: WR-WTB 2.54mm Male Locking Header, 2p; Pin Number: 2; ComponentLink1Description: Manufacturer; ComponentLink1URL: http://www.we-online.de; ComponentLink2Description: Datasheet; ComponentLink2URL: http://katalog.we-online.de/em/datasheet/6190xx11121.pdf; Part Number: 61900211121; Published Date: June 2017; Publisher: Wurth Elektronik; Pitch: 2.54 mm
tantal_classB1 tantal_classB9 = Capacitor Electrolytic: Electrolytic Capacitor
U_FET_DRIVER1 U_FET_DRIVER2 = IR2104STRPBF: Half-Bridge Gate Driver IC Non-Inverting 8-SOIC; MF: Infineon Technologies; SnapEDA_Link: https://www.snapeda.com/parts/IR2104STRPBF/Infineon/view-part/?ref=snap; Package: SOIC-8 Infineon; Value: *; MP: IR2104STRPBF; Check_prices: https://www.snapeda.com/parts/IR2104STRPBF/Infineon/view-part/?ref=eda
U_vo1 U_vo2 = MP1584EN: Buck Switching Regulator IC Positive Adjustable 0.8V 1 Output 3A 8-SOIC (0.154, 3.90mm Width) Exposed Pad; MF: Monolithic Power; SnapEDA_Link: https://www.snapeda.com/parts/MP1584EN/Monolithic+Power+Systems/view-part/?ref=snap; Package: SOIC-8 Monolithic Power; Value: *; MP: MP1584EN; Check_prices: https://www.snapeda.com/parts/MP1584EN/Monolithic+Power+Systems/view-part/?ref=eda
UMCC1 = STM32F103RET6: ARMÂ® CortexÂ®-M3 STM32F1 Microcontroller IC 32-Bit 72MHz 512KB (512K x 8) FLASH 64-LQFP (10x10); MF: STMicroelectronics; SnapEDA_Link: https://www.snapeda.com/parts/STM32F103RET6/STMicroelectronics/view-part/?ref=snap; Package: LQFP-64 STMicroelectronics; Value: *; MP: STM32F103RET6; Check_prices: https://www.snapeda.com/parts/STM32F103RET6/STMicroelectronics/view-part/?ref=eda
Xmt = OSC_25M_NZ2520SB: Oscillator 25.00Mhz, -+50PPM, 3.3V, Temp -55 to +125°C; Manuf_Part_1: NZ2520SB 25MHz END4869B; Manuf_1: NDK; Manuf_Part_2: KC2520B25.0000C10E00; Manuf_2: AVX Corp/Kyocera Corp; ECCN_US/EU: EAR99/NEC; Ref St: 9157031; Provided: ST; Order: *
XX_ADS1115 = ADS1115: MF: Texas Instruments; Value: *; Price: None; Availability: Not in stock; SnapEDA_Link: https://www.snapeda.com/parts/ADS1115/Texas%20Instruments/view-part/6620382/?ref=snap; Check_prices: https://www.snapeda.com/parts/ADS1115/Texas%20Instruments/view-part/6620382/?ref=eda; Package: TFSOP-10 Texas Instruments; MP: ADS1115